# EAGLE design Maxim Adapter Board (EAGLE 7.5.0)
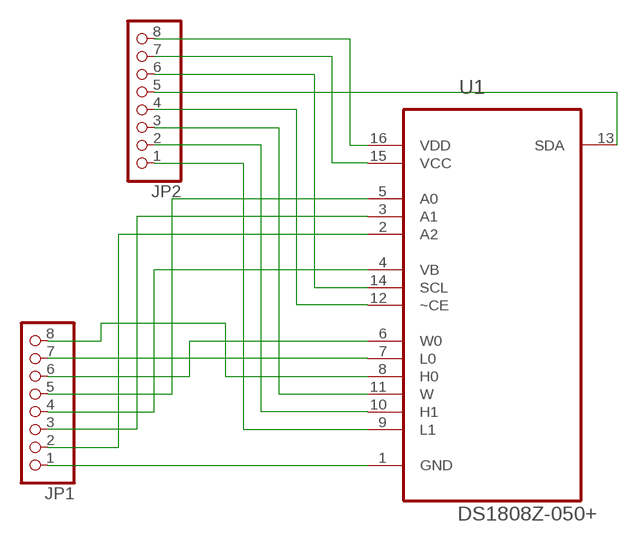
[diagram p0: schematic, sheet 1]

## Parts
JP1  PINHD-1X8  [1X08]
JP2  PINHD-1X8  [1X08]
U1  DS1808Z-050+  [SOIC127P600X175-16N]

## Nets
N$1: JP1.1 U1.1(GND)
N$2: JP1.2 U1.2(A2)
N$3: JP1.3 U1.3(A1)
N$4: JP1.4 U1.4(VB)
N$5: JP1.5 U1.5(A0)
N$6: JP1.6 U1.6(W0)
N$7: JP1.7 U1.7(L0)
N$8: JP1.8 U1.8(H0)
N$9: JP2.1 U1.9(L1)
N$10: JP2.2 U1.10(H1)
N$11: JP2.3 U1.11(W)
N$12: JP2.4 U1.12(~CE)
N$13: JP2.5 U1.13(SDA)
N$14: JP2.6 U1.14(SCL)
N$15: JP2.7 U1.15(VCC)
N$16: JP2.8 U1.16(VDD)

## Library data of the parts
JP1 JP2 = pinhead:PINHD-1X8: PIN HEADER
U1 = Maxim_By_element14_Batch_1:DS1808Z-050+: Dual Log Digital Potentiometer; MPN: DS1808Z-050+; OC_FARNELL: 1379825; OC_NEWARK: 20J3546; PACKAGE: SOIC-16; SUPPLIER: MAXIM INTEGRATED PRODUCTS

## Net classes
0 default: width 0.356 mm

## Board
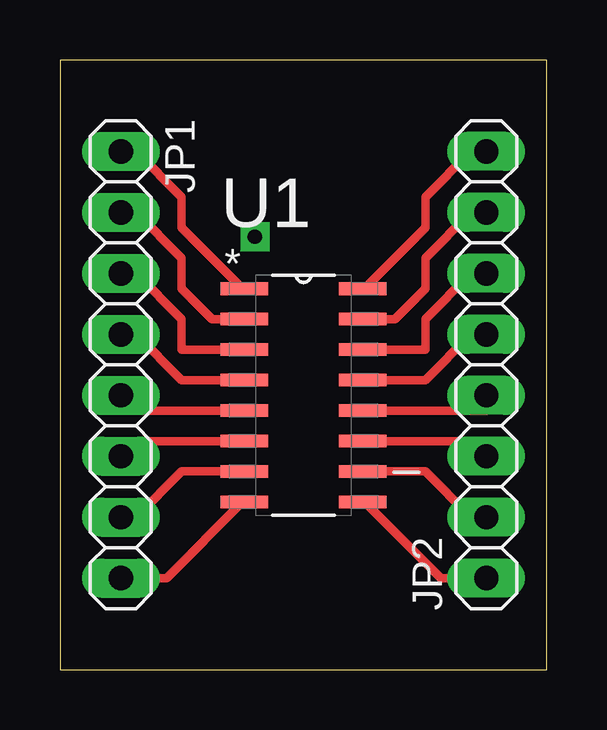
[diagram p1: board, top side]

Size 20.3 x 25.4 mm. Coordinates in mm from the lower left corner, seen from the top.
Outline: 0,0 20.3,0 20.3,25.4 0,25.4 0,0
Copper layers (1*16): Top 0.035mm / dielectric 1.5mm / Bottom 0.035mm
Design rules "LPKF Seneca Routing": minimum track width 12mil, minimum drill 24mil, track to track 14mil, track to pad 14mil, pad to pad 14mil, via to via 14mil, smd to smd 8mil, copper to edge 8mil, drill to drill 8mil, minimum pad ring 12mil, minimum via ring 12mil, stop-mask expansion 4mil, vias tented up to drill 0mil, thermal gap 20mil

### Footprints (pad centres in the part's own frame; a part is rotated, then mirrored left to right if it is on the bottom)
1X08 = drill 1.016 long: 1 -8.89,0; 2 -6.35,0; 3 -3.81,0; 4 -1.27,0; 5 1.27,0; 6 3.81,0; 7 6.35,0; 8 8.89,0
SOIC127P600X175-16N = smd 1.981 x 0.533: 1 -2.464,4.445; 2 -2.464,3.175; 3 -2.464,1.905; 4 -2.464,0.635; 5 -2.464,-0.635; 6 -2.464,-1.905; 7 -2.464,-3.175; 8 -2.464,-4.445; 9 2.464,-4.445; 10 2.464,-3.175; 11 2.464,-1.905; 12 2.464,-0.635; 13 2.464,0.635; 14 2.464,1.905; 15 2.464,3.175; 16 2.464,4.445

### Placement (x,y rotation side)
JP1  2.54,12.7 270 top
JP2  17.78,12.7 90 top
U1  10.16,11.43 0 top

### Tracks (layer width: path | path; a pad name or v marks a point on that pad's centre or on a via)
N$1
  Top 0.356: JP1.1 3.17,21.59 5.08,19.68 5.08,18.41 7.62,15.88 U1.1
N$2
  Top 0.356: U1.2 6.35,14.61 5.08,15.88 5.08,17.14 3.17,19.05 JP1.2
N$3
  Top 0.356: U1.3 5.08,13.34 5.08,14.61 3.17,16.51 JP1.3
N$4
  Top 0.356: U1.4 5.08,12.06 3.17,13.97 JP1.4
N$5
  Top 0.356: U1.5 2.54,10.79 JP1.5
N$6
  Top 0.356: U1.6 2.54,9.53 JP1.6
N$7
  Top 0.356: U1.7 5.08,8.26 3.17,6.35 JP1.7
N$8
  Top 0.356: JP1.8 4.45,3.81 7.62,6.99 U1.8
N$9
  Top 0.356: JP2.1 15.88,3.81 12.7,6.99 U1.9
N$10
  Top 0.356: U1.10 15.24,8.26 17.14,6.35 JP2.2
N$11
  Top 0.356: U1.11 17.78,9.53 JP2.3
N$12
  Top 0.356: U1.12 17.78,10.79 JP2.4
N$13
  Top 0.356: U1.13 15.24,12.06 17.14,13.97 JP2.5
N$14
  Top 0.356: U1.14 15.24,13.34 15.24,14.61 17.14,16.51 JP2.6
N$15
  Top 0.356: U1.15 13.97,14.61 15.24,15.88 15.24,17.14 17.14,19.05 JP2.7
N$16
  Top 0.356: JP2.8 17.14,21.59 15.24,19.68 15.24,18.41 12.7,15.88 U1.16
N$17  (via drill 0.6)
  other vias: 8.13,18.03